# Altium schematic sheet VCC3V3_SYS & VCC_5V0 POWER SUPPLY.SchDoc: AM2434 - 3V3 / 5V main supplies
size A4; Date: 2026-10-16; Revision: PWR-A; SheetNumber: 16; SheetTotal: 17
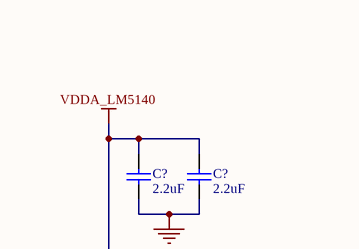
[diagram p0: VCC3V3_SYS & VCC_5V0 POWER SUPPLY.SchDoc, top left]
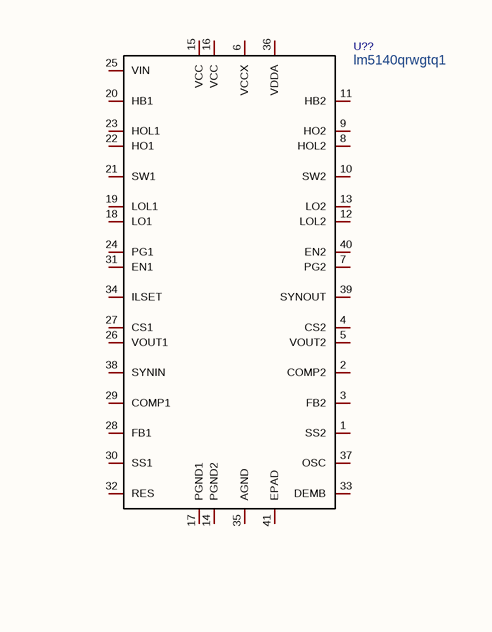
[diagram p1: VCC3V3_SYS & VCC_5V0 POWER SUPPLY.SchDoc, top right]
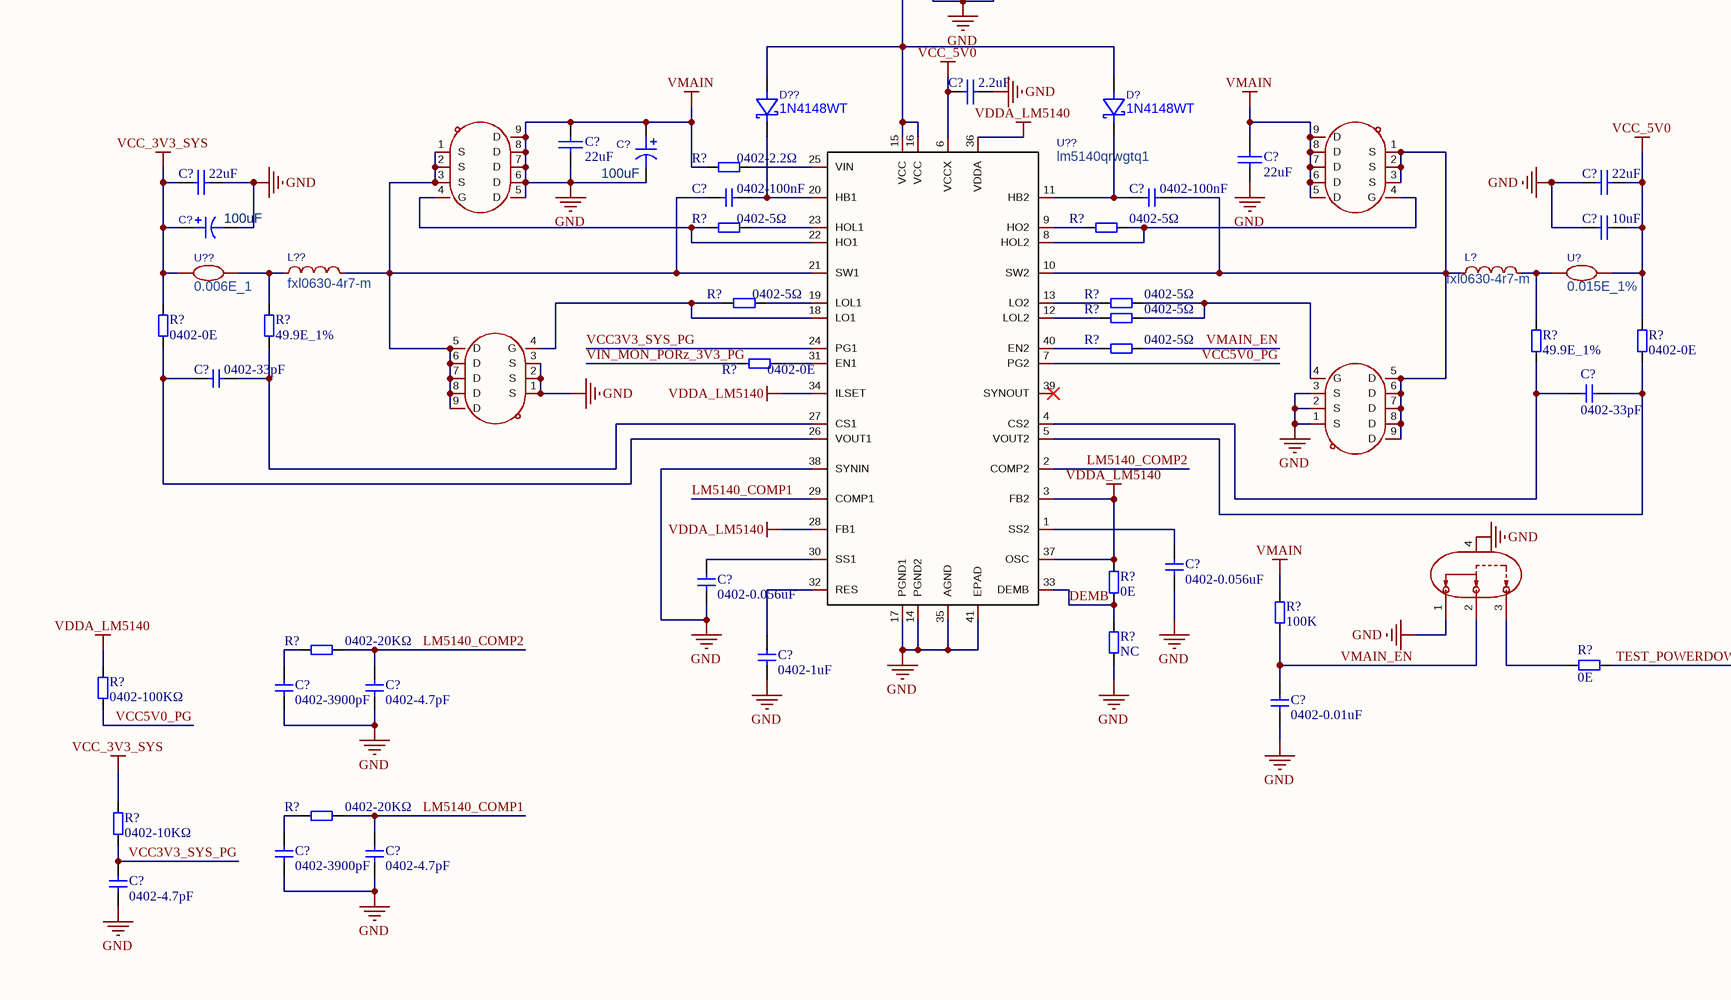
[diagram p2: VCC3V3_SYS & VCC_5V0 POWER SUPPLY.SchDoc, bottom left]
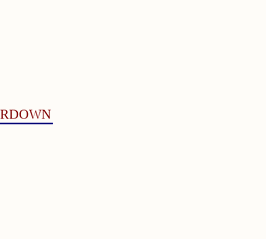
[diagram p3: VCC3V3_SYS & VCC_5V0 POWER SUPPLY.SchDoc, bottom right]

## Parts
(Parts that share a designator on the sheet are numbered #1, #2 ... from top to bottom, then left to right.)
C?#1  2.2uF  [C0603]
C?#2  2.2uF  [C0603]
C?#3  2.2uF  [C0603]
C?#4  22uF  [C0805]
C?#5  100uF  [CAP-SMD_BD6.3-L6.6-W6.6-RD]
C?#6  22uF  [C0805]
C?#7  22uF  [C0805]
C?#8  0402-100nF  [C0402]
C?#9  0402-100nF  [C0402]
C?#10  22uF  [C0805]
C?#11  100uF  [CAP-SMD_BD6.3-L6.6-W6.6-RD]
C?#12  10uF  [C0805]
C?#13  0402-33pF  [C0402]
C?#14  0402-33pF  [C0402]
C?#15  0402-0.056uF  [C0402]
C?#16  0402-0.056uF  [C0402]
C?#17  0402-1uF  [C0402]
C?#18  0402-3900pF  [C0402]
C?#19  0402-4.7pF  [C0402]
C?#20  0402-0.01uF  [C0402]
C?#21  0402-3900pF  [C0402]
C?#22  0402-4.7pF  [C0402]
C?#23  0402-4.7pF  [C0402]
D?  1N4148WT  [SOD-523_L1.2-W0.8-LS1.6-FD]
D??  1N4148WT  [SOD-523_L1.2-W0.8-LS1.6-FD]
L?  fxl0630-4r7-m  [IND-SMD_L7.0-W6.6]
L??  fxl0630-4r7-m  [IND-SMD_L7.0-W6.6]
Q?#1  csd18543q3a  [VSONP-8_L3.1-W3.1-P0.65-LS3.5-BL]  (value not drawn)
Q?#2  csd18543q3a  [VSONP-8_L3.1-W3.1-P0.65-LS3.5-BL]  (value not drawn)
Q??#1  csd18543q3a  [VSONP-8_L3.1-W3.1-P0.65-LS3.5-BL]  (value not drawn)
Q??#2  csd18543q3a  [VSONP-8_L3.1-W3.1-P0.65-LS3.5-BL]  (value not drawn)
R?#1  0402-2.2Ω  [R0402]
R?#2  0402-5Ω  [R0402]
R?#3  0402-5Ω  [R0402]
R?#4  0402-5Ω  [R0402]
R?#5  0402-5Ω  [R0402]
R?#6  0402-5Ω  [R0402]
R?#7  0402-0E  [R0402]
R?#8  49.9E_1%  [R0402]
R?#9  0402-5Ω  [R0402]
R?#10  0402-0E  [R0402]
R?#11  49.9E_1%  [R0402]
R?#12  0402-0E  [R0402]
R?#13  0E  [R0402]
R?#14  100K  [R0402]
R?#15  0402-20KΩ  [R0402]
R?#16  NC  [R0402]
R?#17  0E  [R0402]
R?#18  0402-100KΩ  [R0402]
R?#19  0402-20KΩ  [R0402]
R?#20  0402-10KΩ  [R0402]
U?  0.015E_1%  [R1206]
U??#1  lm5140qrwgtq1  [VQFN-40_L6.0-W6.0-P0.50-BL-EP]
U??#2  0.006E_1  [R1206]
U??#3  lm5140qrwgtq1  [VQFN-40_L6.0-W6.0-P0.50-BL-EP]
U??#4  mss12c02ls-bb2.0  [SW-SMD_MSS12C02LS-HB2.0-1]  (value not drawn)

## Nets
GND: C?#1.1 C?#2.1 C?#3.1 C?#4.1 C?#4.2 C?#5.1 C?#5.2 C?#6.1 C?#6.2 C?#7.1 C?#10.1 C?#11.2 C?#12.1 C?#15.2 C?#16.2 C?#17.2 C?#18.2 C?#19.2 C?#20.2 C?#21.2 C?#22.2 C?#23.2 Q?#1.5(D) Q?#1.6(D) Q?#1.7(D) Q?#1.8(D) Q?#1.9(D) Q?#2.1(S) Q?#2.2(S) Q?#2.3(S) Q??#1.5(D) Q??#1.6(D) Q??#1.7(D) Q??#1.8(D) Q??#1.9(D) Q??#2.1(S) Q??#2.2(S) Q??#2.3(S) R?#1.1 R?#14.2 R?#16.1 U??#3.14(PGND2) U??#3.17(PGND1) U??#3.35(AGND) U??#3.38(SYNIN) U??#3.41(EPAD) U??#4.1 U??#4.4  [also labelled VMAIN]
VCC_3V3_SYS: C?#7.2 C?#11.1 R?#7.2 R?#20.2 U??#2.1
VCC_5V0: C?#3.2 C?#10.2 C?#12.2 R?#12.2 U?.2 U??#3.6(VCCX)
VDDA_LM5140: C?#1.2 C?#2.2 D?.1(A) D??.1(A) R?#13.2 R?#18.2 U??#3.3(FB2) U??#3.15(VCC) U??#3.16(VCC) U??#3.28(FB1) U??#3.34(ILSET) U??#3.36(VDDA) U??#3.37(OSC)
DEMB: R?#13.1 R?#16.2 U??#3.33(DEMB)
LM5140_COMP1: C?#22.1 R?#19.2 U??#3.29(COMP1)
LM5140_COMP2: C?#19.1 R?#15.2 U??#3.2(COMP2)
TEST_POWERDOWN: R?#17.1
VCC3V3_SYS_PG: C?#23.1 R?#20.1 U??#3.24(PG1)
VCC5V0_PG: R?#18.1 U??#3.7(PG2)
VIN_MON_PORz_3V3_PG: R?#10.1
VMAIN_EN: C?#20.1 R?#9.1 R?#14.1 U??#4.2
NetC?#8_1: C?#8.1 L??.2 Q??#1.1(S) Q??#1.2(S) Q??#1.3(S) Q??#2.5(D) Q??#2.6(D) Q??#2.7(D) Q??#2.8(D) Q??#2.9(D) U??#3.21(SW1)
NetC?#8_2: C?#8.2 D??.2(K) U??#3.20(HB1)
NetC?#9_1: C?#9.1 L?.1 Q?#1.1(S) Q?#1.2(S) Q?#1.3(S) Q?#2.5(D) Q?#2.6(D) Q?#2.7(D) Q?#2.8(D) Q?#2.9(D) U??#3.10(SW2)
NetC?#9_2: C?#9.2 D?.2(K) U??#3.11(HB2)
NetC?#13_1: C?#13.1 R?#7.1 U??#3.26(VOUT1)
NetC?#13_2: C?#13.2 R?#8.1 U??#3.27(CS1)
NetC?#14_1: C?#14.1 R?#12.1 U??#3.5(VOUT2)
NetC?#14_2: C?#14.2 R?#11.1 U??#3.4(CS2)
NetC?#15_1: C?#15.1 U??#3.1(SS2)
NetC?#16_1: C?#16.1 U??#3.30(SS1)
NetC?#17_1: C?#17.1 U??#3.32(RES)
NetC?#18_1: C?#18.1 R?#15.1
NetC?#21_1: C?#21.1 R?#19.1
NetL??_1: L??.1 R?#8.2 U??#2.2
NetL?_2: L?.2 R?#11.2 U?.1
NetQ?#1_4: Q?#1.4(G) R?#3.1 U??#3.8(HOL2)
NetQ?#2_4: Q?#2.4(G) R?#5.1 R?#6.1
NetQ??#1_4: Q??#1.4(G) R?#2.1 U??#3.22(HO1)
NetQ??#2_4: Q??#2.4(G) R?#4.1 U??#3.18(LO1)
NetR?#1_2: R?#1.2 U??#3.25(VIN)
NetR?#2_2: R?#2.2 U??#3.23(HOL1)
NetR?#3_2: R?#3.2 U??#3.9(HO2)
NetR?#4_2: R?#4.2 U??#3.19(LOL1)
NetR?#5_2: R?#5.2 U??#3.13(LO2)
NetR?#6_2: R?#6.2 U??#3.12(LOL2)
NetR?#9_2: R?#9.2 U??#3.40(EN2)
NetR?#10_2: R?#10.2 U??#3.31(EN1)
NetR?#17_2: R?#17.2 U??#4.3

Not connected (* = marked no-connect by the designer): U??#1 1(SS2) 2(COMP2) 3(FB2) 4(CS2) 5(VOUT2) 6(VCCX) 7(PG2) 8(HOL2) 9(HO2) 10(SW2) 11(HB2) 12(LOL2) 13(LO2) 14(PGND2) 15(VCC) 16(VCC) 17(PGND1) 18(LO1) 19(LOL1) 20(HB1) 21(SW1) 22(HO1) 23(HOL1) 24(PG1) 25(VIN) 26(VOUT1) 27(CS1) 28(FB1) 29(COMP1) 30(SS1) 31(EN1) 32(RES) 33(DEMB) 34(ILSET) 35(AGND) 36(VDDA) 37(OSC) 38(SYNIN) 39(SYNOUT) 40(EN2) 41(EPAD); U??#3 39(SYNOUT)*

## Library data of the parts
C?#1-C?#3 = C0603: Capacitor; Value: 104; Published: 8-Jun-2000; LatestRevisionDate: 17-Jul-2002; LatestRevisionNote: Re-released for DXP Platform.; Publisher: Altium Limited
C?#4 C?#6 C?#7 C?#10 C?#12 = C0805: Capacitor; Value: 104; Published: 8-Jun-2000; LatestRevisionDate: 17-Jul-2002; LatestRevisionNote: Re-released for DXP Platform.; Publisher: Altium Limited
C?#5 C?#11 = ma35v100m6x8: 容值:100uF;精度:±20%;额定电压:35V;纹波电流:2.9A@100kHz;等效串联电阻(ESR):30mΩ@100kHz;类型:聚合物;; Manufacturer: JIERR(捷而瑞); AddInBom: yes; ModelId: 901941a22e384f799727a46cfda77174; ModelName: CAP-SMD_L6.6-W6.6-H7.0-LS7.2; ModelTransform: 307.086,259.842,0,0,0,0,0,0,0; Tolerance: ±20%; Voltage Rating: 35V; Type: 聚合物; Lifetime: 2000hrs@105℃; Polarity type: 有极性; Symbol: MA35V100M6X8; LCSC Part Name: 100uF ±20% 35V; SupplierPart: C46550467; ManufacturerPart: MA35V100M6X8; Supplier Footprint: SMD,D6.3xL7.7mm; JLCPCB Part Class: Extended Part; Datasheet: https://item.szlcsc.com/datasheet/MA35V100M6X8/48680161.html; Supplier: LCSC; ConvertToPcb: yes; FootprintName: CAP-SMD_BD6.3-L6.6-W6.6-RD; Value: 100uF; Ripple Current: 2.9A@100kHz; Equivalent Series Resistance(ESR): 30mΩ@100kHz; Diameter: 6.3mm; Height - Seated (Max): 7mm; Operating Temperature: -55℃~+105℃
C?#8 C?#9 C?#13-C?#23 = C0402: 物料号: *; 物料描述: *
D? D?? = 1N4148WT: 二极管配置:独立式;整流电流:150mA;直流反向耐压(Vr):100V;正向压降(Vf):1.25V@150mA;反向恢复时间(Trr):4ns;; Manufacturer: R+O(宏嘉诚); Symbol: 1N4148WT_C7420320; AddInBom: yes; ModelId: 8f56a03db567494d8f4c9d12aa52a741; ModelName: SOD-523_L1.2-W0.8-H0.7-LS1.6; ModelTransform: 62.992,31.496,0,0,0,0,0,0,0; Diode Configuration: 独立式; Pd - Power Dissipation: 150mW; Current - Rectified: 150mA; Voltage - DC Reverse(Vr): 100V; Non-Repetitive Peak Forward Surge Current: 2A; Reverse Leakage Current (Ir): 1uA@75V; Reverse Recovery Time (trr): 4ns; Operating Junction Temperature Range: -55℃~+150℃; LCSC Part Name: 100V 150mA; SupplierPart: C7420320; ManufacturerPart: 1N4148WT; Supplier Footprint: SOD-523; JLCPCB Part Class: Extended Part; Datasheet: https://item.szlcsc.com/datasheet/1N4148WT/8397142.html; Supplier: LCSC; ConvertToPcb: yes; FootprintName: SOD-523_L1.2-W0.8-LS1.6-FD; Voltage - Forward(Vf@If): 1.25V@150mA
L? L?? = fxl0630-4r7-m: SMD，7x6.6x2.8mm   合金电感，一体成型电感，大电流; Manufacturer: cjiang(长江微电); AddInBom: yes; ModelId: 6860c29aec394a38a0f014af7f722a42; ModelName: IND-SMD_L7.0-W6.6-H3.0; ModelTransform: 275.59,259.88137,0,0,0,0,0,0,0; Value: 4.7uH; Tolerance: ±20%; Current Rating: 6A; Current - Saturation(Isat): 9A; DC Resistance(DCR): 33mΩ; Type: 一体成型电感; Symbol: FXL0630-4R7-M; LCSC Part Name: 4.7uH ±20% 9A; SupplierPart: C167220; ManufacturerPart: FXL0630-4R7-M; Supplier Footprint: SMD,7x6.6mm; JLCPCB Part Class: Extended Part; Datasheet: https://item.szlcsc.com/datasheet/FXL0630-4R7-M/178603.html; Supplier: LCSC; ConvertToPcb: yes; FootprintName: IND-SMD_L7.0-W6.6
Q?#1 Q?#2 Q??#1 Q??#2 = csd18543q3a: 数量:1个N沟道;漏源电压(Vdss):60V;连续漏极电流(Id):60A;导通电阻(RDS(on)):8.1mΩ@10V;耗散功率(Pd):66W;阈值电压(Vgs(th)):2V;; Manufacturer: TI(德州仪器); AddInBom: yes; ModelId: 3ca62a27ecf447829a39b8428e2a4ea6; ModelName: VSON-CLIP-8_L3.1-W3.0-H0.8-P0.65; ModelTransform: 129.921,118.8974,0,0,0,0,0.497,-3.992,0; Number: 1个N沟道; Drain to Source Voltage: 60V; Current - Continuous Drain(Id): 60A; Pd - Power Dissipation: 66W; Gate Threshold Voltage (Vgs(th)): 2V; Gate Charge(Qg): 11.1nC@10V; Input Capacitance(Ciss): 885pF; Reverse Transfer Capacitance (Crss@Vds): 4.8pF; Type: N沟道; Output Capacitance(Coss): 168pF; Symbol: CSD18543Q3A; LCSC Part Name: 60V、N沟道功率MOSFET; SupplierPart: C840100; ManufacturerPart: CSD18543Q3A; Supplier Footprint: VSONP-8(3.3x3.3); JLCPCB Part Class: Extended Part; Datasheet: https://www.ti.com/cn/lit/ds/symlink/csd18543q3a.pdf; Supplier: LCSC; ConvertToPcb: yes; FootprintName: VSONP-8_L3.1-W3.1-P0.65-LS3.5-BL; RDS(on): 8.1mΩ@10V; Operating Temperature: -55℃~+150℃
R?#1-R?#20 = R0402: 片式电阻; 物料描述: 片式电阻器-0805-10KΩ-5%-JT; 物料号: NA
U? U??#2 = frm121wfr010tm: 电阻类型:采样电阻;阻值:10mΩ;精度:±1%;工作电压:-;功率:1W;温度系数:±50ppm/℃;安装方式:-;; Manufacturer: FOJAN(富捷); AddInBom: yes; ModelId: 89a1f13db2384da588040e0b3c55bf66; ModelName: R1206_L3.2-W1.6-H0.6; ModelTransform: 125.984,62.992,0,0,0,0,0,0,0; Value: 10mΩ; Tolerance: ±1%; Power(Watts): 1W; Symbol: FRM121WFR010TM; LCSC Part Name: 10mΩ ±1% 1W; SupplierPart: C7467248; ManufacturerPart: FRM121WFR010TM; Supplier Footprint: 1206; JLCPCB Part Class: Extended Part; Datasheet: https://item.szlcsc.com/datasheet/FRM121WFR010TM/8513848.html; Supplier: LCSC; ConvertToPcb: yes; FootprintName: R1206; Type: 采样电阻; Voltage Rating: -; Current Rating: -; Temperature Coefficient: ±50ppm/℃; Mounting Type: -
U??#1 U??#3 = lm5140qrwgtq1: 功能类型:降压型;工作电压:3.8V~65V;输出电压:1.5V~15V;输出电流:-;输出类型:可调;; Manufacturer: TI(德州仪器); AddInBom: yes; ModelId: 9abaade914744556b7a2df475e9925e7; ModelName: VQFN-40_L6.0-W6.0-H1.0-P0.50; ModelTransform: 237.007,237.007,0,90,0,0,-0.005,0.005,0; Function: 降压型; Frequency - Switching: 440kHz; Synchronous Rectifier: 是; Number of Outputs: 2; Topology: 降压式; Quiescent Current: 35uA; Switch tube (built-in/external): 外置; Output Type: 可调; Symbol: LM5140QRWGTQ1; LCSC Part Name: 降压型 3.8V~65V; SupplierPart: C201623; ManufacturerPart: LM5140QRWGTQ1; Supplier Footprint: VQFN-40-EP(6x6); JLCPCB Part Class: Extended Part; Datasheet: https://www.ti.com/cn/lit/gpn/lm5140-q1; Supplier: LCSC; ConvertToPcb: yes; FootprintName: VQFN-40_L6.0-W6.0-P0.50-BL-EP; Voltage - Supply: 3.8V~65V; Output Voltage: 1.5V~15V; Output Current: -; Operating Temperature: -40℃~+150℃@(TJ); Features: 轻载高效模式；频率同步；逐波限流；可调软启动；过流保护；工作状态指示；可调限流；打嗝限流
U??#4 = mss12c02ls-bb2.0: 电路结构:单刀双掷;安装方式:立贴;开关颜色:白色;额定电流:50mA;额定电压:12V;工作寿命:1万次;; Manufacturer: SHOU HAN(首韩); AddInBom: yes; ModelId: 7f5e09f8c3bf4d79a7a083d494104806; ModelTransform: 307.086,148.0312,0,0,0,0,0,-5.866,-19.685; Circuit: 单刀双掷; Actuator Style: 矩形柱状; Switch Height: 3.4mm; Actuator Color: 白色; Current Rating: 50mA; Voltage Rating: 12V; Life: 1万次; Symbol: MSS12C02LS-BB2.0; LCSC Part Name: MSS12C02LS-BB2.0; SupplierPart: C3008585; ManufacturerPart: MSS12C02LS-BB2.0; Supplier Footprint: SMD,6.7x2.8mm; JLCPCB Part Class: Extended Part; Datasheet: https://item.szlcsc.com/datasheet/MSS12C02LS-BB2.0/3501432.html; Supplier: LCSC; ConvertToPcb: yes; FootprintName: SW-SMD_MSS12C02LS-HB2.0-1; ModelName: SW-SMD_MSS12C02LS-HB2.0-1; Termination Style: SMD接片; Length: 6.65mm; Width: 2.75mm; Mounting Type: 立贴; Operating Temperature: -25℃~+70℃